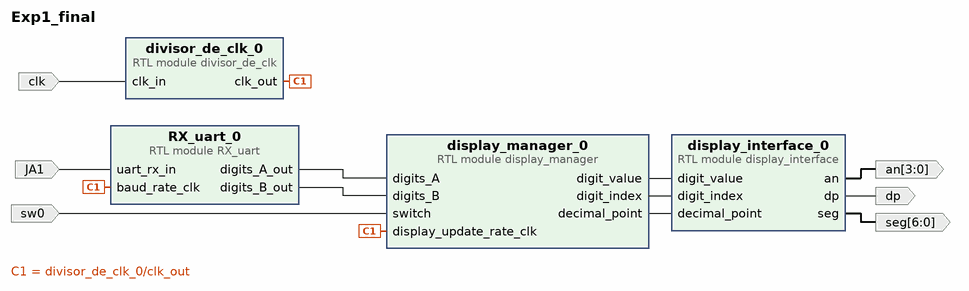
[diagram p0: block diagram of the top level]
# Vivado block design Exp1_final, xc7a35tcpg236-1, Vivado 2020.1
create_bd_design Exp1_final

create_bd_port -dir I sw0
create_bd_port -dir I clk
create_bd_port -dir O -from 6 -to 0 seg
create_bd_port -dir O dp
create_bd_port -dir O -from 3 -to 0 an
create_bd_port -dir I JA1

create_bd_cell -type module -reference display_manager display_manager_0
create_bd_cell -type module -reference divisor_de_clk divisor_de_clk_0
create_bd_cell -type module -reference display_interface display_interface_0
create_bd_cell -type module -reference RX_uart RX_uart_0

# ---- connections ----

connect_bd_net [get_bd_pins RX_uart_0/digits_A_out] [get_bd_pins display_manager_0/digits_A]
connect_bd_net [get_bd_pins RX_uart_0/digits_B_out] [get_bd_pins display_manager_0/digits_B]
connect_bd_net -net switch_0_1 [get_bd_ports sw0] [get_bd_pins display_manager_0/switch]
connect_bd_net [get_bd_pins divisor_de_clk_0/clk_out] [get_bd_pins display_manager_0/display_update_rate_clk] [get_bd_pins RX_uart_0/baud_rate_clk]
connect_bd_net -net clk_in_0_1 [get_bd_ports clk] [get_bd_pins divisor_de_clk_0/clk_in]
connect_bd_net [get_bd_pins display_manager_0/digit_value] [get_bd_pins display_interface_0/digit_value]
connect_bd_net [get_bd_pins display_manager_0/digit_index] [get_bd_pins display_interface_0/digit_index]
connect_bd_net [get_bd_pins display_manager_0/decimal_point] [get_bd_pins display_interface_0/decimal_point]
connect_bd_net [get_bd_pins display_interface_0/seg] [get_bd_ports seg]
connect_bd_net [get_bd_pins display_interface_0/dp] [get_bd_ports dp]
connect_bd_net [get_bd_pins display_interface_0/an] [get_bd_ports an]
connect_bd_net -net uart_rx_in_0_1 [get_bd_ports JA1] [get_bd_pins RX_uart_0/uart_rx_in]

validate_bd_design
save_bd_design
